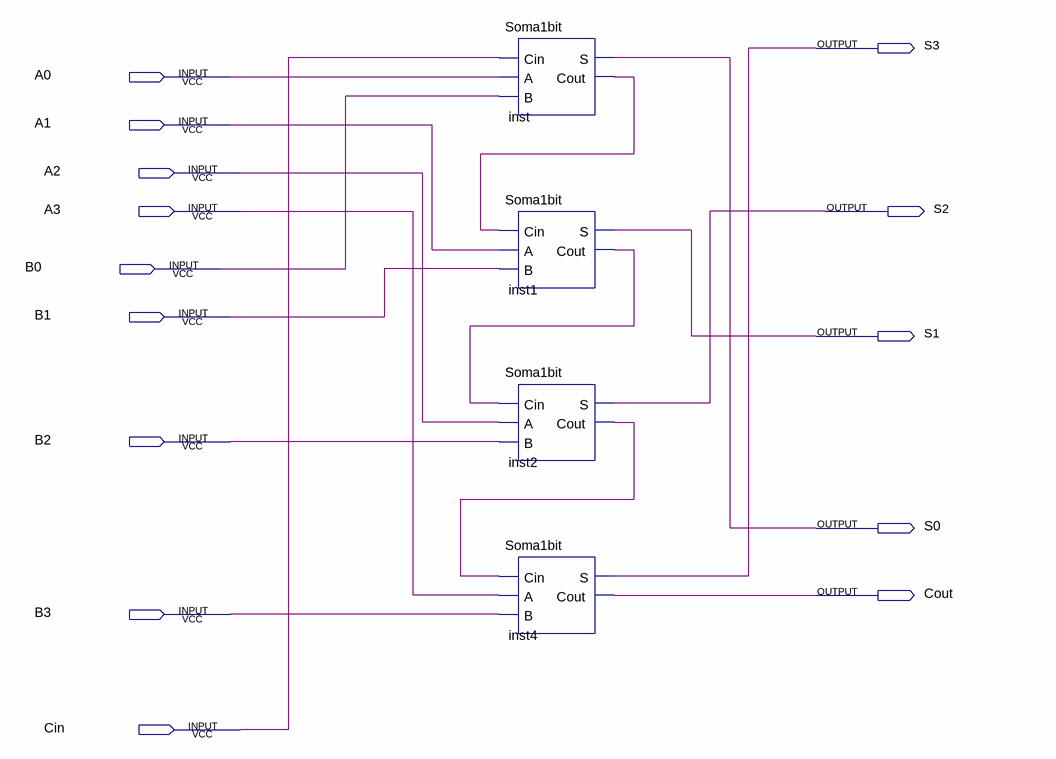
[diagram p0: schematic sheet]
// Quartus schematic Soma4bits.bdf as structural Verilog: 4 symbols, 14 pins
module Soma4bits (
  input  A0,
  input  A1,
  input  A2,
  input  A3,
  input  B0,
  input  B1,
  input  B2,
  input  B3,
  input  Cin,
  output S3,
  output S2,
  output S1,
  output S0,
  output Cout
);

  wire inst1_cout, inst2_cout, inst_cout;

  Soma1bit inst (.Cin(Cin), .A(A0), .B(B0), .S(S0), .Cout(inst_cout));
  Soma1bit inst1 (.Cin(inst_cout), .A(A1), .B(B1), .S(S1), .Cout(inst1_cout));
  Soma1bit inst2 (.Cin(inst1_cout), .A(A2), .B(B2), .S(S2), .Cout(inst2_cout));
  Soma1bit inst4 (.Cin(inst2_cout), .A(A3), .B(B3), .S(S3), .Cout(Cout));
endmodule
